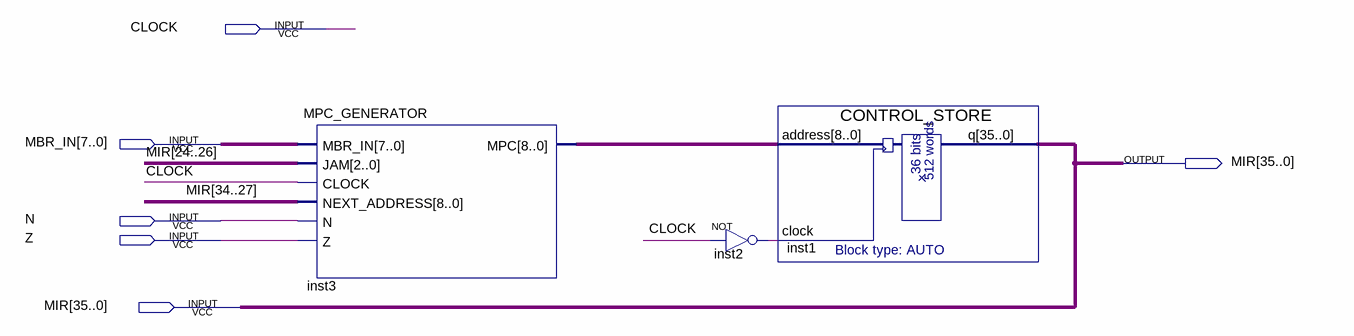
[diagram p0: schematic sheet]
// Quartus schematic MCPANDCONTROLSTORE.bdf as structural Verilog: 3 symbols, 6 pins
module MCPANDCONTROLSTORE (
  input  CLOCK,
  input  [7:0] MBR_IN,
  input  N,
  input  Z,
  inout  [35:0] MIR
);

  wire inst2_out;
  wire [8:0] inst3_mpc;

  MPC_GENERATOR inst3 (
    .MBR_IN(MBR_IN), .JAM({MIR[24], MIR[25], MIR[26]}), .CLOCK(CLOCK), .NEXT_ADDRESS(MIR[34:27]), .N(N),
    .Z(Z), .MPC(inst3_mpc));
  not inst2 (inst2_out, CLOCK);
  CONTROL_STORE inst1 (.address(inst3_mpc), .clock(inst2_out), .q(MIR));
endmodule
